# Altium schematic sheet Top_Sheet.SchDoc
size A4; SheetNumber: 1; SheetTotal: 4
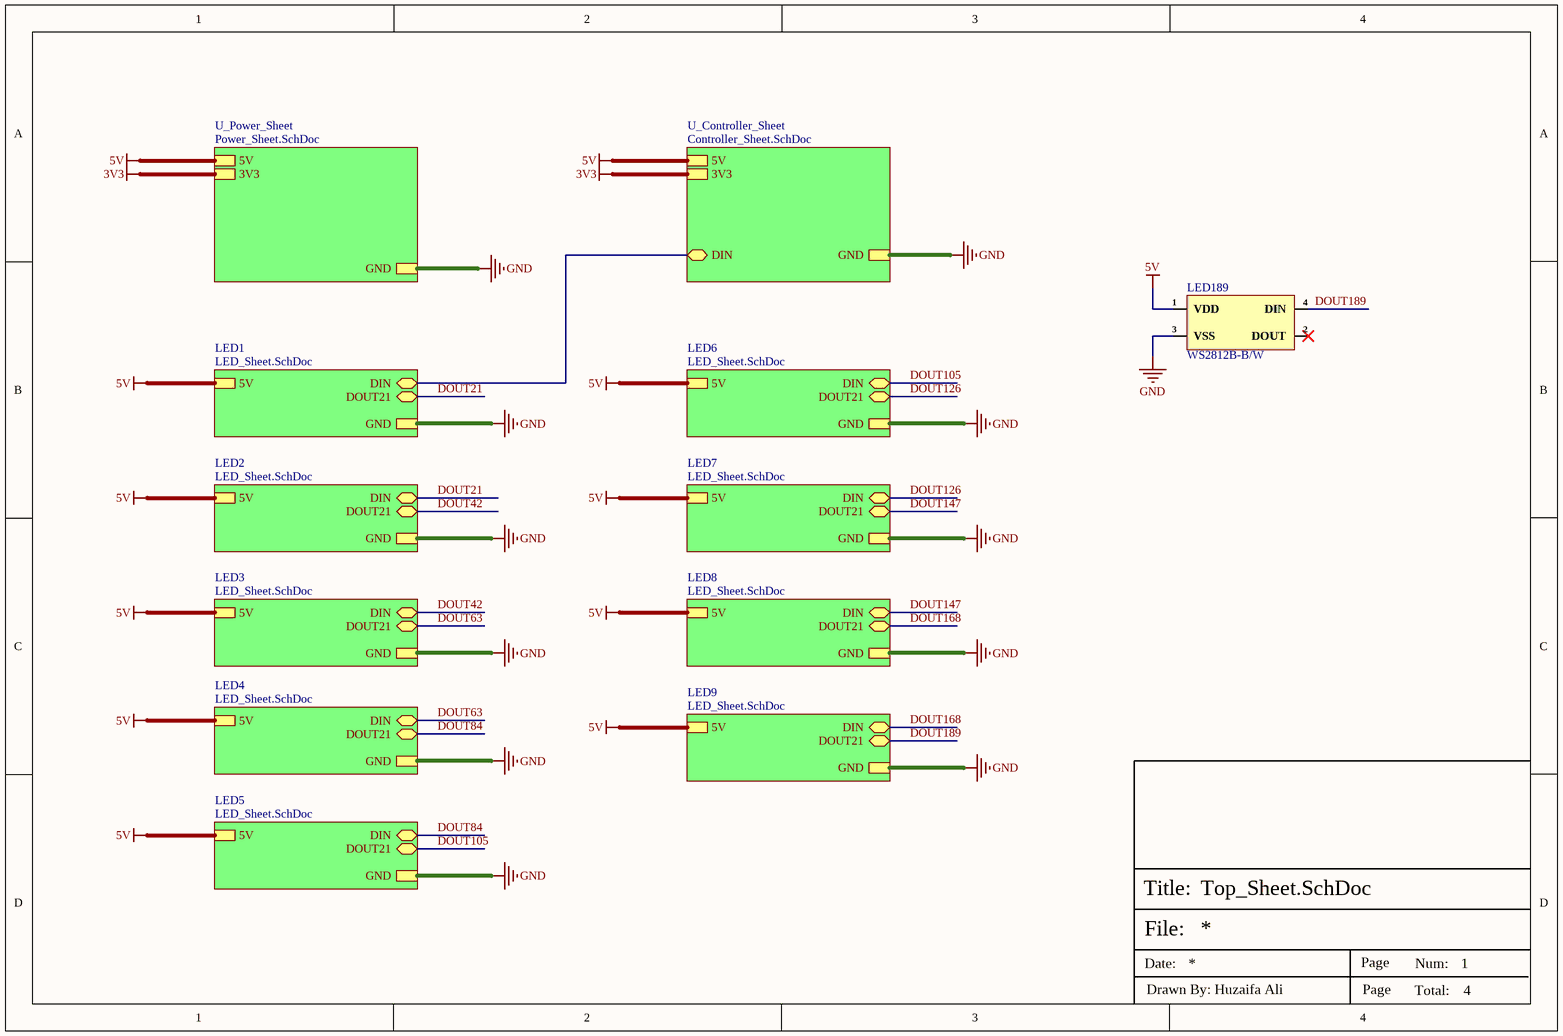
[diagram p0: Top_Sheet.SchDoc]

## Parts
LED189  WS2812B-B/W  [WS2812B-B/W]

## Sub-sheets
LED1 = LED_Sheet.SchDoc: DIN (bidir), GND, 5V, DOUT21 (bidir)
LED2 = LED_Sheet.SchDoc: DIN (bidir), GND, 5V, DOUT21 (bidir)
LED3 = LED_Sheet.SchDoc: DIN (bidir), GND, 5V, DOUT21 (bidir)
LED4 = LED_Sheet.SchDoc: DIN (bidir), GND, 5V, DOUT21 (bidir)
LED5 = LED_Sheet.SchDoc: DIN (bidir), GND, 5V, DOUT21 (bidir)
LED6 = LED_Sheet.SchDoc: DIN (bidir), GND, 5V, DOUT21 (bidir)
LED7 = LED_Sheet.SchDoc: DIN (bidir), GND, 5V, DOUT21 (bidir)
LED8 = LED_Sheet.SchDoc: DIN (bidir), GND, 5V, DOUT21 (bidir)
LED9 = LED_Sheet.SchDoc: DIN (bidir), GND, 5V, DOUT21 (bidir)
U_Controller_Sheet = Controller_Sheet.SchDoc: 3V3, GND, 5V, DIN (bidir)
U_Power_Sheet = Power_Sheet.SchDoc: 3V3, GND, 5V

## Nets
3V3: sheet U_Controller_Sheet/3V3, sheet U_Power_Sheet/3V3
5V: LED189.1(VDD) ; sheet U_Controller_Sheet/5V, sheet U_Power_Sheet/5V, sheet LED1/5V, sheet LED2/5V, sheet LED3/5V, sheet LED4/5V, sheet LED5/5V, sheet LED6/5V, sheet LED7/5V, sheet LED8/5V, sheet LED9/5V
GND: LED189.3(VSS) ; sheet U_Controller_Sheet/GND, sheet U_Power_Sheet/GND, sheet LED1/GND, sheet LED2/GND, sheet LED3/GND, sheet LED4/GND, sheet LED5/GND, sheet LED6/GND, sheet LED7/GND, sheet LED8/GND, sheet LED9/GND
DOUT21: sheet LED1/DOUT21, sheet LED2/DIN
DOUT42: sheet LED2/DOUT21, sheet LED3/DIN
DOUT63: sheet LED3/DOUT21, sheet LED4/DIN
DOUT84: sheet LED4/DOUT21, sheet LED5/DIN
DOUT105: sheet LED5/DOUT21, sheet LED6/DIN
DOUT126: sheet LED6/DOUT21, sheet LED7/DIN
DOUT147: sheet LED7/DOUT21, sheet LED8/DIN
DOUT168: sheet LED8/DOUT21, sheet LED9/DIN
DOUT189: LED189.4(DIN) ; sheet LED9/DOUT21
(unnamed): sheet U_Controller_Sheet/DIN, sheet LED1/DIN

Not connected (* = marked no-connect by the designer): LED189 2(DOUT)*

## Notes on the sheet
- File:
- Title:
- Date:
- Page
- Num:
- Total:
- Drawn By: Huzaifa Ali

## Library data of the parts
LED189 = WS2812B-B/W: RGB SMD5050 Light Emitting Diodes (LED) ROHS; Manufacturer: Worldsemi; Item Type: RGB LED; Manufacturer Part Number: WS2812B-B/W; Package: SMD5050; LCSC Part Number: C114586; ComponentLink1Description: LCSC; ComponentLink1URL: https://www.lcsc.com/product-detail/Light-Emitting-Diodes-LED_Worldsemi-WS2812B-B-W_C114586.html